# Altium project QCMI_SOM8MM.PrjPcb (part 3 of 3)
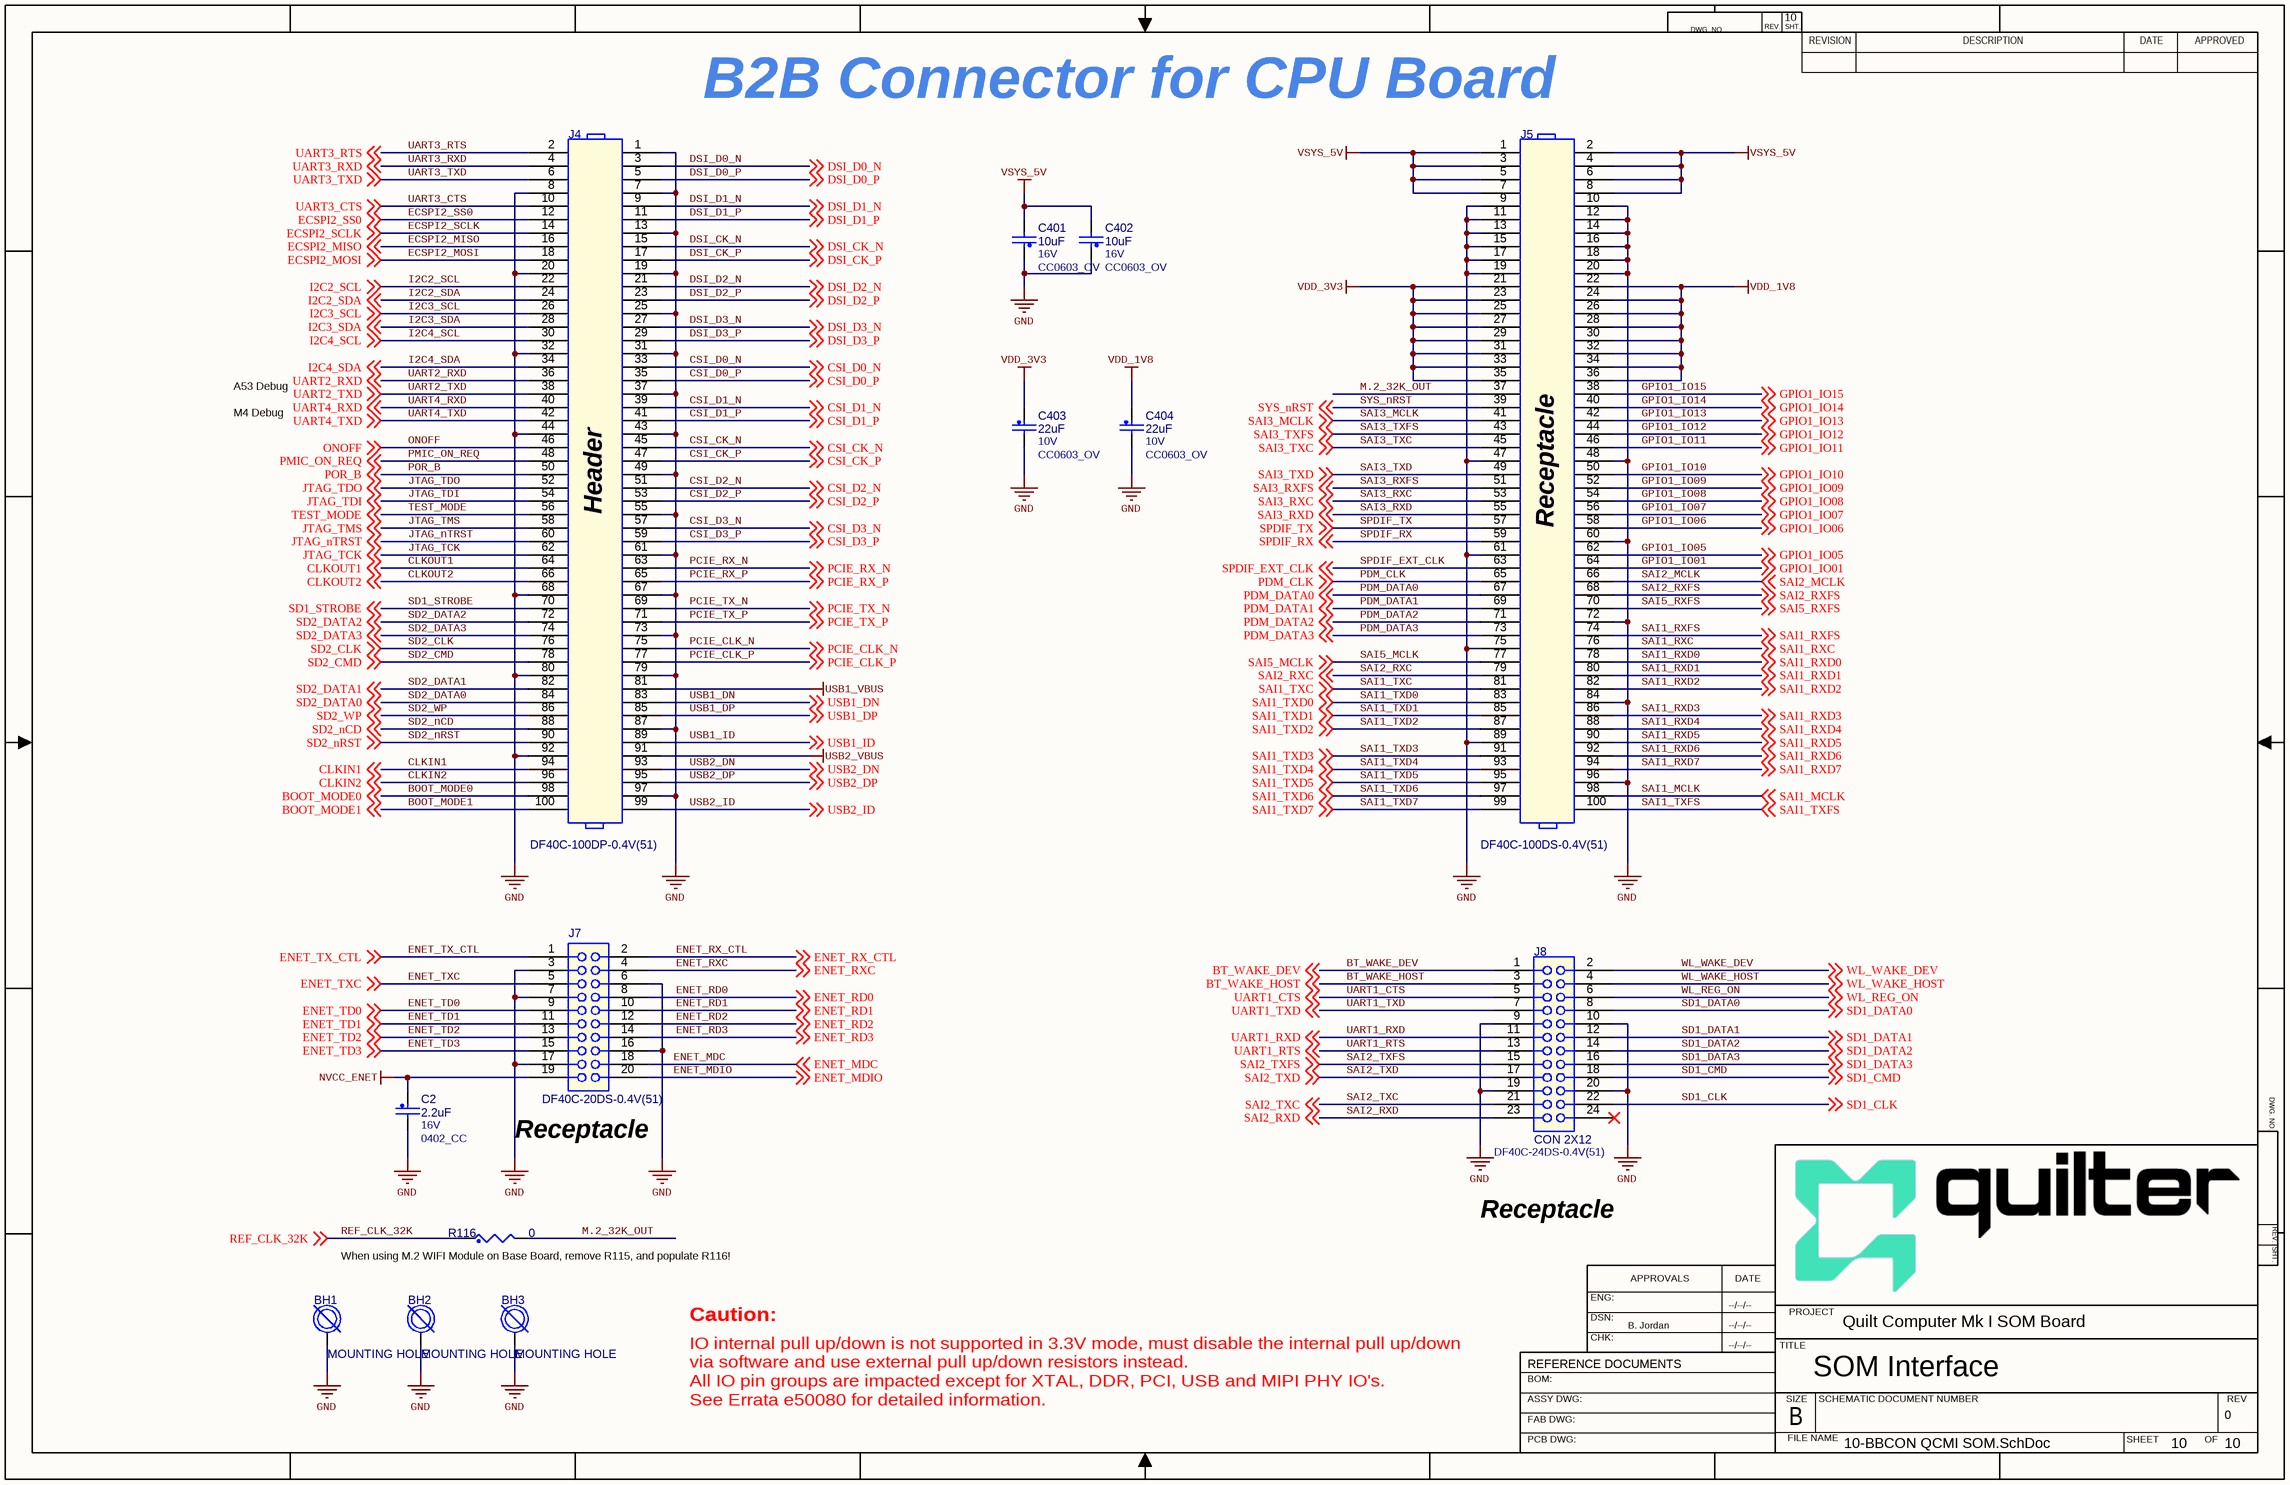
[diagram p12: 10-BBCON QCMI SOM.SchDoc]

## Nets that join several sheets
GND: 02-CPUPWR QCMI SOM (159 pins), 03-CPULPDDR4 QCMI SOM (90 pins), 04-CPUIO QCMI SOM (C245.2 Q1.2), 05-CPUPHY QCMI SOM (5 pins), 06-CPUCTL QCMI SOM (8 pins), 07-FLASH QCMI SOM (24 pins), 09-PMIC QCMI SOM (39 pins), 10-BBCON QCMI SOM (61 pins)
NVCC_DRAM_1V1: 02-CPUPWR QCMI SOM (21 pins), 03-CPULPDDR4 QCMI SOM (66 pins), 09-PMIC QCMI SOM (C324.1 L15.2 U8.52)
NVCC_ENET: 02-CPUPWR QCMI SOM (C392.1 U1.W22), 10-BBCON QCMI SOM (C2.1 J7.19)
NVCC_SD2: 02-CPUPWR QCMI SOM (C17.1 U1.V22), 04-CPUIO QCMI SOM (R119.1 R120.1 R133.1), 09-PMIC QCMI SOM (C365.1 U8.55)
NVCC_SNVS_1V8: 02-CPUPWR QCMI SOM (C391.1 U1.J22), 06-CPUCTL QCMI SOM (R20.1 R21.1 R102.1), 09-PMIC QCMI SOM (C333.1 U8.3)
USB1_VBUS: 05-CPUPHY QCMI SOM (C393.1 R108.2), 10-BBCON QCMI SOM (J4.81)
USB2_VBUS: 05-CPUPHY QCMI SOM (C394.1 R109.2), 10-BBCON QCMI SOM (J4.91)
VDD_1V8: 02-CPUPWR QCMI SOM (17 pins), 03-CPULPDDR4 QCMI SOM (16 pins), 04-CPUIO QCMI SOM (8 pins), 07-FLASH QCMI SOM (15 pins), 08-BOOTCFG QMCI SOM (R47.2 R79.2), 09-PMIC QCMI SOM (C317.1 L13.2 R106.1 U8.14), 10-BBCON QCMI SOM (9 pins)
VDD_3V3: 02-CPUPWR QCMI SOM (10 pins), 04-CPUIO QCMI SOM (R125.1), 07-FLASH QCMI SOM (7 pins), 08-BOOTCFG QMCI SOM (6 pins), 09-PMIC QCMI SOM (10 pins), 10-BBCON QCMI SOM (9 pins)
VDD_ARM_0V9: 02-CPUPWR QCMI SOM (20 pins), 09-PMIC QCMI SOM (5 pins)
VDD_DRAM&PU_0V9: 02-CPUPWR QCMI SOM (27 pins), 09-PMIC QCMI SOM (5 pins)
VDD_PHY_0V9: 02-CPUPWR QCMI SOM (C1.1 U1.J14), 09-PMIC QCMI SOM (C360.1 U8.1)
VDD_PHY_1V2: 02-CPUPWR QCMI SOM (C244.1 C405.1 U1.J15), 09-PMIC QCMI SOM (C408.1 U10.5)
VDD_SNVS_0V8: 02-CPUPWR QCMI SOM (C9.1 U1.K22), 06-CPUCTL QCMI SOM (R113.1), 09-PMIC QCMI SOM (C337.1 U8.2)
VDD_SOC_0V8: 02-CPUPWR QCMI SOM (25 pins), 09-PMIC QCMI SOM (5 pins)
VDDA_1V8: 02-CPUPWR QCMI SOM (17 pins), 09-PMIC QCMI SOM (C363.1 U8.54)
VSYS_5V: 09-PMIC QCMI SOM (23 pins), 10-BBCON QCMI SOM (10 pins)
BOOT_MODE0: 06-CPUCTL QCMI SOM (U1.G26), 08-BOOTCFG QMCI SOM (R47.1), 10-BBCON QCMI SOM (J4.98)
BOOT_MODE1: 06-CPUCTL QCMI SOM (U1.G27), 08-BOOTCFG QMCI SOM (R79.1), 10-BBCON QCMI SOM (J4.100)
BT_WAKE_DEV: 04-CPUIO QCMI SOM (U1.U26), 10-BBCON QCMI SOM (J8.1)
BT_WAKE_HOST: 04-CPUIO QCMI SOM (U1.W27), 10-BBCON QCMI SOM (J8.3)
CLK_32K_OUT: 06-CPUCTL QCMI SOM (R100.1), 09-PMIC QCMI SOM (U8.7)
CLKIN1: 06-CPUCTL QCMI SOM (U1.H27), 10-BBCON QCMI SOM (J4.94)
CLKIN2: 06-CPUCTL QCMI SOM (U1.J27), 10-BBCON QCMI SOM (J4.96)
CLKOUT1: 06-CPUCTL QCMI SOM (U1.H26), 10-BBCON QCMI SOM (J4.64)
CLKOUT2: 06-CPUCTL QCMI SOM (U1.J26), 10-BBCON QCMI SOM (J4.66)
CSI_CK_N: 05-CPUPHY QCMI SOM (U1.A16), 10-BBCON QCMI SOM (J4.45)
CSI_CK_P: 05-CPUPHY QCMI SOM (U1.B16), 10-BBCON QCMI SOM (J4.47)
CSI_D0_N: 05-CPUPHY QCMI SOM (U1.A14), 10-BBCON QCMI SOM (J4.33)
CSI_D0_P: 05-CPUPHY QCMI SOM (U1.B14), 10-BBCON QCMI SOM (J4.35)
CSI_D1_N: 05-CPUPHY QCMI SOM (U1.A15), 10-BBCON QCMI SOM (J4.39)
CSI_D1_P: 05-CPUPHY QCMI SOM (U1.B15), 10-BBCON QCMI SOM (J4.41)
CSI_D2_N: 05-CPUPHY QCMI SOM (U1.A17), 10-BBCON QCMI SOM (J4.51)
CSI_D2_P: 05-CPUPHY QCMI SOM (U1.B17), 10-BBCON QCMI SOM (J4.53)
CSI_D3_N: 05-CPUPHY QCMI SOM (U1.A18), 10-BBCON QCMI SOM (J4.57)
CSI_D3_P: 05-CPUPHY QCMI SOM (U1.B18), 10-BBCON QCMI SOM (J4.59)
DSI_CK_N: 05-CPUPHY QCMI SOM (U1.A11), 10-BBCON QCMI SOM (J4.15)
DSI_CK_P: 05-CPUPHY QCMI SOM (U1.B11), 10-BBCON QCMI SOM (J4.17)
DSI_D0_N: 05-CPUPHY QCMI SOM (U1.A9), 10-BBCON QCMI SOM (J4.3)
DSI_D0_P: 05-CPUPHY QCMI SOM (U1.B9), 10-BBCON QCMI SOM (J4.5)
DSI_D1_N: 05-CPUPHY QCMI SOM (U1.A10), 10-BBCON QCMI SOM (J4.9)
DSI_D1_P: 05-CPUPHY QCMI SOM (U1.B10), 10-BBCON QCMI SOM (J4.11)
DSI_D2_N: 05-CPUPHY QCMI SOM (U1.A12), 10-BBCON QCMI SOM (J4.21)
DSI_D2_P: 05-CPUPHY QCMI SOM (U1.B12), 10-BBCON QCMI SOM (J4.23)
DSI_D3_N: 05-CPUPHY QCMI SOM (U1.A13), 10-BBCON QCMI SOM (J4.27)
DSI_D3_P: 05-CPUPHY QCMI SOM (U1.B13), 10-BBCON QCMI SOM (J4.29)
ECSPI2_MISO: 04-CPUIO QCMI SOM (U1.A8), 10-BBCON QCMI SOM (J4.16)
ECSPI2_MOSI: 04-CPUIO QCMI SOM (U1.B8), 10-BBCON QCMI SOM (J4.18)
ECSPI2_SCLK: 04-CPUIO QCMI SOM (U1.E6), 10-BBCON QCMI SOM (J4.14)
ECSPI2_SS0: 04-CPUIO QCMI SOM (U1.A6), 10-BBCON QCMI SOM (J4.12)
ENET_MDC: 04-CPUIO QCMI SOM (U1.AC27), 10-BBCON QCMI SOM (J7.18)
ENET_MDIO: 04-CPUIO QCMI SOM (U1.AB27), 10-BBCON QCMI SOM (J7.20)
ENET_RD0: 04-CPUIO QCMI SOM (U1.AE27), 10-BBCON QCMI SOM (J7.8)
ENET_RD1: 04-CPUIO QCMI SOM (U1.AD27), 10-BBCON QCMI SOM (J7.10)
ENET_RD2: 04-CPUIO QCMI SOM (U1.AD26), 10-BBCON QCMI SOM (J7.12)
ENET_RD3: 04-CPUIO QCMI SOM (U1.AC26), 10-BBCON QCMI SOM (J7.14)
ENET_RX_CTL: 04-CPUIO QCMI SOM (U1.AF27), 10-BBCON QCMI SOM (J7.2)
ENET_RXC: 04-CPUIO QCMI SOM (U1.AE26), 10-BBCON QCMI SOM (J7.4)
ENET_TD0: 04-CPUIO QCMI SOM (U1.AG26), 10-BBCON QCMI SOM (J7.9)
ENET_TD1: 04-CPUIO QCMI SOM (U1.AF26), 10-BBCON QCMI SOM (J7.11)
ENET_TD2: 04-CPUIO QCMI SOM (U1.AG25), 10-BBCON QCMI SOM (J7.13)
ENET_TD3: 04-CPUIO QCMI SOM (U1.AF25), 10-BBCON QCMI SOM (J7.15)
ENET_TX_CTL: 04-CPUIO QCMI SOM (U1.AF24), 10-BBCON QCMI SOM (J7.1)
ENET_TXC: 04-CPUIO QCMI SOM (U1.AG24), 10-BBCON QCMI SOM (J7.5)
GPIO1_IO01: 04-CPUIO QCMI SOM (U1.AF14), 10-BBCON QCMI SOM (J5.64)
GPIO1_IO05: 04-CPUIO QCMI SOM (U1.AF12), 10-BBCON QCMI SOM (J5.62)
GPIO1_IO06: 04-CPUIO QCMI SOM (U1.AG11), 10-BBCON QCMI SOM (J5.58)
GPIO1_IO07: 04-CPUIO QCMI SOM (U1.AF11), 10-BBCON QCMI SOM (J5.56)
GPIO1_IO08: 04-CPUIO QCMI SOM (U1.AG10), 10-BBCON QCMI SOM (J5.54)
GPIO1_IO09: 04-CPUIO QCMI SOM (U1.AF10), 10-BBCON QCMI SOM (J5.52)
GPIO1_IO10: 04-CPUIO QCMI SOM (U1.AD10), 10-BBCON QCMI SOM (J5.50)
GPIO1_IO11: 04-CPUIO QCMI SOM (U1.AC10), 10-BBCON QCMI SOM (J5.46)
GPIO1_IO12: 04-CPUIO QCMI SOM (U1.AB10), 10-BBCON QCMI SOM (J5.44)
GPIO1_IO13: 04-CPUIO QCMI SOM (U1.AD9), 10-BBCON QCMI SOM (J5.42)
GPIO1_IO14: 04-CPUIO QCMI SOM (U1.AC9), 10-BBCON QCMI SOM (J5.40)
GPIO1_IO15: 04-CPUIO QCMI SOM (U1.AB9), 10-BBCON QCMI SOM (J5.38)
I2C1_SCL: 04-CPUIO QCMI SOM (R10.2 U1.E9), 09-PMIC QCMI SOM (R48.1)
I2C1_SDA: 04-CPUIO QCMI SOM (R11.2 U1.F9), 09-PMIC QCMI SOM (R54.1)
I2C2_SCL: 04-CPUIO QCMI SOM (R12.2 U1.D10), 10-BBCON QCMI SOM (J4.22)
I2C2_SDA: 04-CPUIO QCMI SOM (R13.2 U1.D9), 10-BBCON QCMI SOM (J4.24)
I2C3_SCL: 04-CPUIO QCMI SOM (R14.2 U1.E10), 10-BBCON QCMI SOM (J4.26)
I2C3_SDA: 04-CPUIO QCMI SOM (R15.2 U1.F10), 10-BBCON QCMI SOM (J4.28)
I2C4_SCL: 04-CPUIO QCMI SOM (R16.2 U1.D13), 10-BBCON QCMI SOM (J4.30)
I2C4_SDA: 04-CPUIO QCMI SOM (R17.2 U1.E13), 10-BBCON QCMI SOM (J4.34)
JTAG_nTRST: 06-CPUCTL QCMI SOM (U1.C27), 10-BBCON QCMI SOM (J4.60)
JTAG_TCK: 06-CPUCTL QCMI SOM (R18.1 U1.F26), 10-BBCON QCMI SOM (J4.62)
JTAG_TDI: 06-CPUCTL QCMI SOM (U1.E27), 10-BBCON QCMI SOM (J4.54)
JTAG_TDO: 06-CPUCTL QCMI SOM (U1.E26), 10-BBCON QCMI SOM (J4.52)
JTAG_TMS: 06-CPUCTL QCMI SOM (U1.F27), 10-BBCON QCMI SOM (J4.58)
ONOFF: 06-CPUCTL QCMI SOM (R21.2 U1.A25), 10-BBCON QCMI SOM (J4.46)
PCIE_CLK_N: 05-CPUPHY QCMI SOM (U1.A21), 10-BBCON QCMI SOM (J4.75)
PCIE_CLK_P: 05-CPUPHY QCMI SOM (U1.B21), 10-BBCON QCMI SOM (J4.77)
PCIE_RX_N: 05-CPUPHY QCMI SOM (U1.A19), 10-BBCON QCMI SOM (J4.63)
PCIE_RX_P: 05-CPUPHY QCMI SOM (U1.B19), 10-BBCON QCMI SOM (J4.65)
PCIE_TX_N: 05-CPUPHY QCMI SOM (U1.A20), 10-BBCON QCMI SOM (J4.69)
PCIE_TX_P: 05-CPUPHY QCMI SOM (U1.B20), 10-BBCON QCMI SOM (J4.71)
PDM_CLK: 04-CPUIO QCMI SOM (U1.AC15), 10-BBCON QCMI SOM (J5.65)
PDM_DATA0: 04-CPUIO QCMI SOM (U1.AD18), 10-BBCON QCMI SOM (J5.67)
PDM_DATA1: 04-CPUIO QCMI SOM (U1.AC14), 10-BBCON QCMI SOM (J5.69)
PDM_DATA2: 04-CPUIO QCMI SOM (U1.AD13), 10-BBCON QCMI SOM (J5.71)
PDM_DATA3: 04-CPUIO QCMI SOM (U1.AC13), 10-BBCON QCMI SOM (J5.73)
PMIC_nINT: 04-CPUIO QCMI SOM (U1.AF13), 09-PMIC QCMI SOM (U8.13)
PMIC_ON_REQ: 06-CPUCTL QCMI SOM (U1.A24), 09-PMIC QCMI SOM (R51.1), 10-BBCON QCMI SOM (J4.48)
PMIC_STBY_REQ: 06-CPUCTL QCMI SOM (U1.E24), 09-PMIC QCMI SOM (R52.1)
POR_B: 06-CPUCTL QCMI SOM (R20.2 U1.B24), 09-PMIC QCMI SOM (R114.2), 10-BBCON QCMI SOM (J4.50)
QSPIA_DATA0: 04-CPUIO QCMI SOM (U1.P23), 07-FLASH QCMI SOM (U5.5)
QSPIA_DATA1: 04-CPUIO QCMI SOM (U1.K24), 07-FLASH QCMI SOM (U5.2)
QSPIA_DATA2: 04-CPUIO QCMI SOM (U1.K23), 07-FLASH QCMI SOM (U5.3)
QSPIA_DATA3: 04-CPUIO QCMI SOM (U1.N23), 07-FLASH QCMI SOM (U5.7)
QSPIA_nSS0: 04-CPUIO QCMI SOM (U1.N24), 07-FLASH QCMI SOM (R37.2 U5.1)
QSPIA_SCLK: 04-CPUIO QCMI SOM (U1.N22), 07-FLASH QCMI SOM (U5.6)
REF_CLK_32K: 04-CPUIO QCMI SOM (U1.AG14), 10-BBCON QCMI SOM (R116.1)
RTC_RESET_B: 06-CPUCTL QCMI SOM (R102.2 U1.F24), 09-PMIC QCMI SOM (R111.2)
SAI1_MCLK: 04-CPUIO QCMI SOM (U1.AB18), 10-BBCON QCMI SOM (J5.98)
SAI1_RXC: 04-CPUIO QCMI SOM (U1.AF16), 10-BBCON QCMI SOM (J5.76)
SAI1_RXD0: 04-CPUIO QCMI SOM (U1.AG15), 10-BBCON QCMI SOM (J5.78)
SAI1_RXD1: 04-CPUIO QCMI SOM (U1.AF15), 08-BOOTCFG QMCI SOM (R76.1), 10-BBCON QCMI SOM (J5.80)
SAI1_RXD2: 04-CPUIO QCMI SOM (U1.AG17), 08-BOOTCFG QMCI SOM (R75.1), 10-BBCON QCMI SOM (J5.82)
SAI1_RXD3: 04-CPUIO QCMI SOM (U1.AF17), 10-BBCON QCMI SOM (J5.86)
SAI1_RXD4: 04-CPUIO QCMI SOM (U1.AG18), 10-BBCON QCMI SOM (J5.88)
SAI1_RXD5: 04-CPUIO QCMI SOM (U1.AF18), 08-BOOTCFG QMCI SOM (R72.1), 10-BBCON QCMI SOM (J5.90)
SAI1_RXD6: 04-CPUIO QCMI SOM (U1.AG19), 08-BOOTCFG QMCI SOM (R71.1), 10-BBCON QCMI SOM (J5.92)
SAI1_RXD7: 04-CPUIO QCMI SOM (U1.AF19), 10-BBCON QCMI SOM (J5.94)
SAI1_RXFS: 04-CPUIO QCMI SOM (U1.AG16), 10-BBCON QCMI SOM (J5.74)
SAI1_TXC: 04-CPUIO QCMI SOM (U1.AC18), 10-BBCON QCMI SOM (J5.81)
SAI1_TXD0: 04-CPUIO QCMI SOM (U1.AG20), 10-BBCON QCMI SOM (J5.83)
SAI1_TXD1: 04-CPUIO QCMI SOM (U1.AF20), 10-BBCON QCMI SOM (J5.85)
SAI1_TXD2: 04-CPUIO QCMI SOM (U1.AG21), 10-BBCON QCMI SOM (J5.87)
SAI1_TXD3: 04-CPUIO QCMI SOM (U1.AF21), 08-BOOTCFG QMCI SOM (R97.1), 10-BBCON QCMI SOM (J5.91)
SAI1_TXD4: 04-CPUIO QCMI SOM (U1.AG22), 10-BBCON QCMI SOM (J5.93)
SAI1_TXD5: 04-CPUIO QCMI SOM (U1.AF22), 08-BOOTCFG QMCI SOM (R95.1), 10-BBCON QCMI SOM (J5.95)
SAI1_TXD6: 04-CPUIO QCMI SOM (U1.AG23), 10-BBCON QCMI SOM (J5.97)
SAI1_TXD7: 04-CPUIO QCMI SOM (U1.AF23), 10-BBCON QCMI SOM (J5.99)
SAI1_TXFS: 04-CPUIO QCMI SOM (U1.AB19), 10-BBCON QCMI SOM (J5.100)
SAI2_MCLK: 04-CPUIO QCMI SOM (U1.AD19), 10-BBCON QCMI SOM (J5.66)
SAI2_RXC: 04-CPUIO QCMI SOM (U1.AB22), 10-BBCON QCMI SOM (J5.79)
SAI2_RXD: 04-CPUIO QCMI SOM (U1.AC24), 10-BBCON QCMI SOM (J8.23)
SAI2_RXFS: 04-CPUIO QCMI SOM (U1.AC19), 10-BBCON QCMI SOM (J5.68)
SAI2_TXC: 04-CPUIO QCMI SOM (U1.AD22), 10-BBCON QCMI SOM (J8.21)
SAI2_TXD: 04-CPUIO QCMI SOM (U1.AC22), 10-BBCON QCMI SOM (J8.17)
SAI2_TXFS: 04-CPUIO QCMI SOM (U1.AD23), 10-BBCON QCMI SOM (J8.15)
SAI3_MCLK: 04-CPUIO QCMI SOM (U1.AD6), 10-BBCON QCMI SOM (J5.41)
SAI3_RXC: 04-CPUIO QCMI SOM (U1.AG7), 10-BBCON QCMI SOM (J5.53)
SAI3_RXD: 04-CPUIO QCMI SOM (U1.AF7), 10-BBCON QCMI SOM (J5.55)
SAI3_RXFS: 04-CPUIO QCMI SOM (U1.AG8), 10-BBCON QCMI SOM (J5.51)
SAI3_TXC: 04-CPUIO QCMI SOM (U1.AG6), 10-BBCON QCMI SOM (J5.45)
SAI3_TXD: 04-CPUIO QCMI SOM (U1.AF6), 10-BBCON QCMI SOM (J5.49)
SAI3_TXFS: 04-CPUIO QCMI SOM (U1.AC6), 10-BBCON QCMI SOM (J5.43)
SAI5_MCLK: 04-CPUIO QCMI SOM (U1.AD15), 10-BBCON QCMI SOM (J5.77)
SAI5_RXFS: 04-CPUIO QCMI SOM (U1.AB15), 10-BBCON QCMI SOM (J5.70)
SD1_CLK: 04-CPUIO QCMI SOM (U1.V26), 10-BBCON QCMI SOM (J8.22)
SD1_CMD: 04-CPUIO QCMI SOM (U1.V27), 10-BBCON QCMI SOM (J8.18)
SD1_DATA0: 04-CPUIO QCMI SOM (U1.Y27), 10-BBCON QCMI SOM (J8.8)
SD1_DATA1: 04-CPUIO QCMI SOM (U1.Y26), 10-BBCON QCMI SOM (J8.12)
SD1_DATA2: 04-CPUIO QCMI SOM (U1.T27), 10-BBCON QCMI SOM (J8.14)
SD1_DATA3: 04-CPUIO QCMI SOM (U1.T26), 10-BBCON QCMI SOM (J8.16)
SD1_STROBE: 04-CPUIO QCMI SOM (U1.R24), 10-BBCON QCMI SOM (J4.70)
SD2_CLK: 04-CPUIO QCMI SOM (U1.W23), 10-BBCON QCMI SOM (J4.76)
SD2_CMD: 04-CPUIO QCMI SOM (R120.2 U1.W24), 10-BBCON QCMI SOM (J4.78)
SD2_DATA0: 04-CPUIO QCMI SOM (R119.2 U1.AB23), 10-BBCON QCMI SOM (J4.84)
SD2_DATA1: 04-CPUIO QCMI SOM (U1.AB24), 10-BBCON QCMI SOM (J4.82)
SD2_DATA2: 04-CPUIO QCMI SOM (U1.V24), 10-BBCON QCMI SOM (J4.72)
SD2_DATA3: 04-CPUIO QCMI SOM (U1.V23), 10-BBCON QCMI SOM (J4.74)
SD2_nCD: 04-CPUIO QCMI SOM (U1.AA26), 10-BBCON QCMI SOM (J4.88)
SD2_nRST: 04-CPUIO QCMI SOM (R133.2 U1.AB26), 10-BBCON QCMI SOM (J4.90)
SD2_VSEL: 04-CPUIO QCMI SOM (U1.AG12), 09-PMIC QCMI SOM (U8.29)
SD2_WP: 04-CPUIO QCMI SOM (U1.AA27), 10-BBCON QCMI SOM (J4.86)
SD3_CLK: 04-CPUIO QCMI SOM (U1.R26), 07-FLASH QCMI SOM (U4.M6)
SD3_CMD: 04-CPUIO QCMI SOM (U1.R27), 07-FLASH QCMI SOM (R118.2 U4.M5)
SD3_DATA0: 04-CPUIO QCMI SOM (U1.M26), 07-FLASH QCMI SOM (R117.2 U4.A3)
SD3_DATA1: 04-CPUIO QCMI SOM (U1.L26), 07-FLASH QCMI SOM (U4.A4)
SD3_DATA2: 04-CPUIO QCMI SOM (U1.K26), 07-FLASH QCMI SOM (U4.A5)
SD3_DATA3: 04-CPUIO QCMI SOM (U1.N26), 07-FLASH QCMI SOM (U4.B2)
SD3_DATA4: 04-CPUIO QCMI SOM (U1.N27), 07-FLASH QCMI SOM (U4.B3)
SD3_DATA5: 04-CPUIO QCMI SOM (U1.M27), 07-FLASH QCMI SOM (U4.B4)
SD3_DATA6: 04-CPUIO QCMI SOM (U1.L27), 07-FLASH QCMI SOM (U4.B5)
SD3_DATA7: 04-CPUIO QCMI SOM (U1.K27), 07-FLASH QCMI SOM (U4.B6)
SD3_STROBE: 04-CPUIO QCMI SOM (U1.P27), 07-FLASH QCMI SOM (U4.H5)
SPDIF_EXT_CLK: 04-CPUIO QCMI SOM (U1.AF8), 10-BBCON QCMI SOM (J5.63)
SPDIF_RX: 04-CPUIO QCMI SOM (U1.AG9), 10-BBCON QCMI SOM (J5.59)
SPDIF_TX: 04-CPUIO QCMI SOM (U1.AF9), 10-BBCON QCMI SOM (J5.57)
SYS_nRST: 09-PMIC QCMI SOM (R127.1), 10-BBCON QCMI SOM (J5.39)
TEST_MODE: 06-CPUCTL QCMI SOM (R134.2), 10-BBCON QCMI SOM (J4.56)
UART1_CTS: 04-CPUIO QCMI SOM (U1.E18), 10-BBCON QCMI SOM (J8.5)
UART1_RTS: 04-CPUIO QCMI SOM (U1.D18), 10-BBCON QCMI SOM (J8.13)
UART1_RXD: 04-CPUIO QCMI SOM (U1.E14), 10-BBCON QCMI SOM (J8.11)
UART1_TXD: 04-CPUIO QCMI SOM (U1.F13), 10-BBCON QCMI SOM (J8.7)
UART2_RXD: 04-CPUIO QCMI SOM (U1.F15), 10-BBCON QCMI SOM (J4.36)
UART2_TXD: 04-CPUIO QCMI SOM (U1.E15), 10-BBCON QCMI SOM (J4.38)
UART3_CTS: 04-CPUIO QCMI SOM (U1.A7), 10-BBCON QCMI SOM (J4.10)
UART3_RTS: 04-CPUIO QCMI SOM (U1.B6), 10-BBCON QCMI SOM (J4.2)
UART3_RXD: 04-CPUIO QCMI SOM (U1.D6), 10-BBCON QCMI SOM (J4.4)
UART3_TXD: 04-CPUIO QCMI SOM (U1.B7), 10-BBCON QCMI SOM (J4.6)
UART4_RXD: 04-CPUIO QCMI SOM (U1.F19), 10-BBCON QCMI SOM (J4.40)
UART4_TXD: 04-CPUIO QCMI SOM (U1.F18), 10-BBCON QCMI SOM (J4.42)
USB1_DN: 05-CPUPHY QCMI SOM (U1.A22), 10-BBCON QCMI SOM (J4.83)
USB1_DP: 05-CPUPHY QCMI SOM (U1.B22), 10-BBCON QCMI SOM (J4.85)
USB1_ID: 05-CPUPHY QCMI SOM (U1.D22), 10-BBCON QCMI SOM (J4.89)
USB2_DN: 05-CPUPHY QCMI SOM (U1.A23), 10-BBCON QCMI SOM (J4.93)
USB2_DP: 05-CPUPHY QCMI SOM (U1.B23), 10-BBCON QCMI SOM (J4.95)
USB2_ID: 05-CPUPHY QCMI SOM (U1.D23), 10-BBCON QCMI SOM (J4.99)
WDOG_B: 04-CPUIO QCMI SOM (U1.AG13), 09-PMIC QCMI SOM (R55.1)
WL_REG_ON: 04-CPUIO QCMI SOM (U1.R23), 10-BBCON QCMI SOM (J8.6)
WL_WAKE_DEV: 04-CPUIO QCMI SOM (U1.U27), 10-BBCON QCMI SOM (J8.2)
WL_WAKE_HOST: 04-CPUIO QCMI SOM (U1.W26), 10-BBCON QCMI SOM (J8.4)

## Assembly variants
Factory: not fitted BH1 BH2 BH3 R47 R71 R72 R75 R76 R79 R95 R97